# EasyEDA Pro project glyph_project_file.epro

# Schematic YourDisp
Board Name: YourDisp; Create Date: 2026-06-23; Page Name: Sheet_1; Project Name: yourdisp1; Schematic Name: YourDisp; Update Date: 2026-07-16; Add into BOM: yes; Company: Trust Me Bro; Convert to PCB: yes; Date: 2026-05-26; REV: 1.0; Sheet: 1/1; spicePre: .
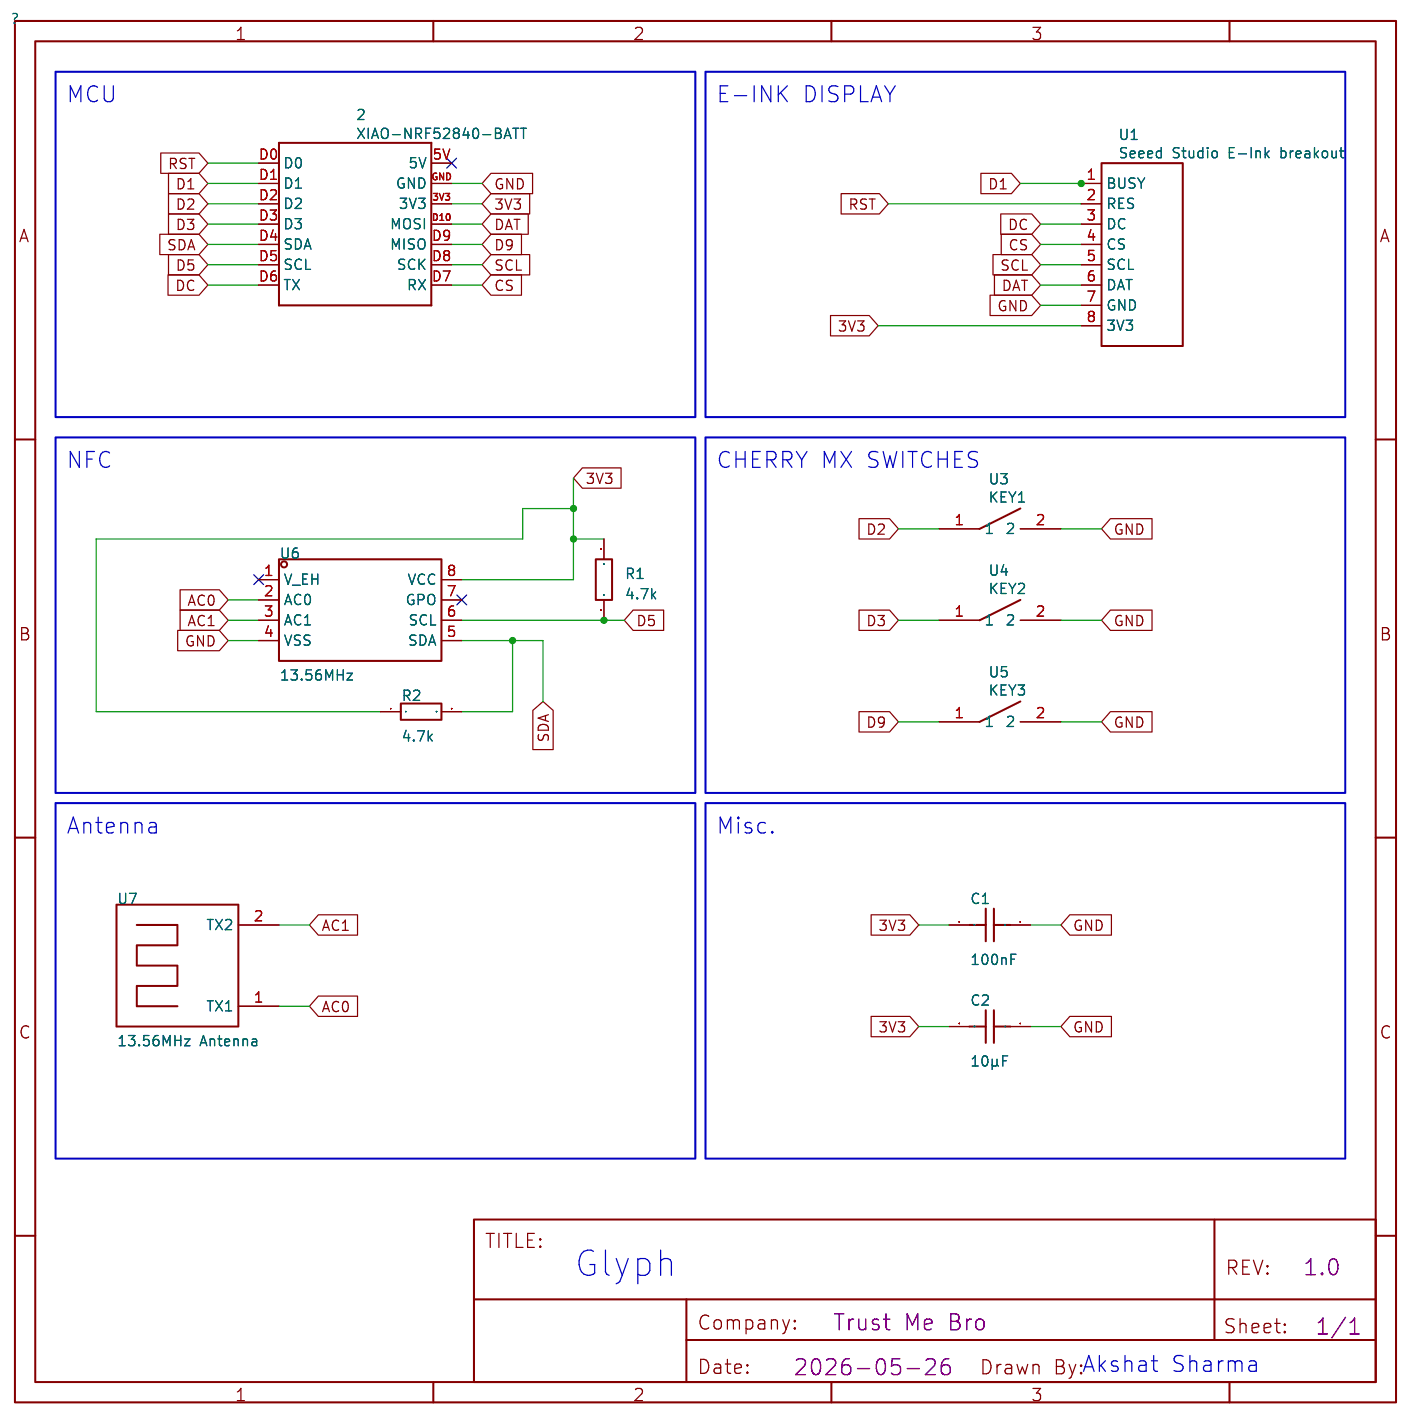
[diagram p0: schematic sheet]

## Parts
2  XIAO-NRF52840-BATT  [XIAO-NRF52840-BATT]
C1  100nF  [C0201]
C2  10µF  [C0201]
R1  4.7k  [R0402]
R2  4.7k  [R0402]
U1  Seeed Studio E-Ink breakout  [EPAPER BREAKOUT BOARD FOR SEEED STUDIO XIAO]
U3  KEY1  [CHERRY-MX_1U]
U4  KEY2  [CHERRY-MX_1U]
U5  KEY3  [CHERRY-MX_1U]
U6  13.56MHz  [SOIC-8_L5.0-W4.0-P1.27-LS6.0-BL]
U7  13.56MHz Antenna  [13.56MHZ-ANTENNA]

## Library data of the parts
2 = XIAO-NRF52840-BATT: Contributor: team6612; spicePre: ?
C1 C2 = CAP_0201: Supplier Footprint: 0201
R1 R2 = Res_0402: Supplier Footprint: 0402
U1 = Seeed Studio E-Ink breakout: Manufacturer: Seeed Studio; Manufacturer Part: 105990172; Supplier: Digi-Key; link: https://www.seeedstudio.com/ePaper-Breakout-Board-p-5804.html; Contributor: Guest; spicePre: U
U3 = KEY1: Contributor: tbremner_12; spicePre: U; spiceSymbolName: CHERRY-MX
U4 = KEY2: Contributor: tbremner_12; spicePre: U; spiceSymbolName: CHERRY-MX
U5 = KEY3: Contributor: tbremner_12; spicePre: U; spiceSymbolName: CHERRY-MX
U6 = ST25DV04K-IER6S3: agreement:ISO 15693,NFC Interface:I2C transmission rate:53Kbit/s Frequency:13.56MHz Frequency:13.56MHz Voltage - Supply:1.8V~5.5V Voltage - Supply:1.8V~5.5V Quiescent Current:1uA Features:Energy harvesting；Low power wake-up；Built-in non-volatile memory; LCSC Part Name: 动态NFC/RFID标签IC; Supplier Part: C155601; Manufacturer: ST(意法半导体); Supplier Footprint: SOIC-8; JLCPCB Part Class: Extended Part; Datasheet: https://item.szlcsc.com/datasheet/ST25DV04K-IER6S3/166943.html; Supplier: LCSC; agreement: ISO 15693,NFC; Interface: I2C; transmission rate: 53Kbit/s; Voltage - Supply: 1.8V~5.5V; Quiescent Current: 1uA; Features: Energy harvesting；Low power wake-up；Built-in non-volatile memory
U7 = 13.56MHz Antenna

## Nets
3V3: 2.3V3 C1.2 C2.2 R1.2 R2.1 U1.8(3V3) U6.8(VCC)
GND: 2.GND C1.1 C2.1 U1.7(GND) U3.2 U4.2 U5.2 U6.4(VSS)
AC0: U6.2(AC0) U7.1(TX1)
AC1: U6.3(AC1) U7.2(TX2)
CS: 2.D7(RX) U1.4(CS)
D1: 2.D1 U1.1(BUSY)
D2: 2.D2 U3.1
D3: 2.D3 U4.1
D5: 2.D5(SCL) R1.1 U6.6(SCL)
D9: 2.D9(MISO) U5.1
DAT: 2.D10(MOSI) U1.6(DAT)
DC: 2.D6(TX) U1.3(DC)
RST: 2.D0 U1.2(RES)
SCL: 2.D8(SCK) U1.5(SCL)
SDA: 2.D4(SDA) R2.2 U6.5(SDA)

Not connected (* = marked no-connect by the designer): 2 5V*; U6 1(V_EH)* 7(GPO)*

## Notes on the sheet
- MCU
- E-INK DISPLAY
- NFC
- CHERRY MX SWITCHES
- Antenna
- Misc.
- Glyph
- Akshat Sharma

# Board pcb_Yourdisp
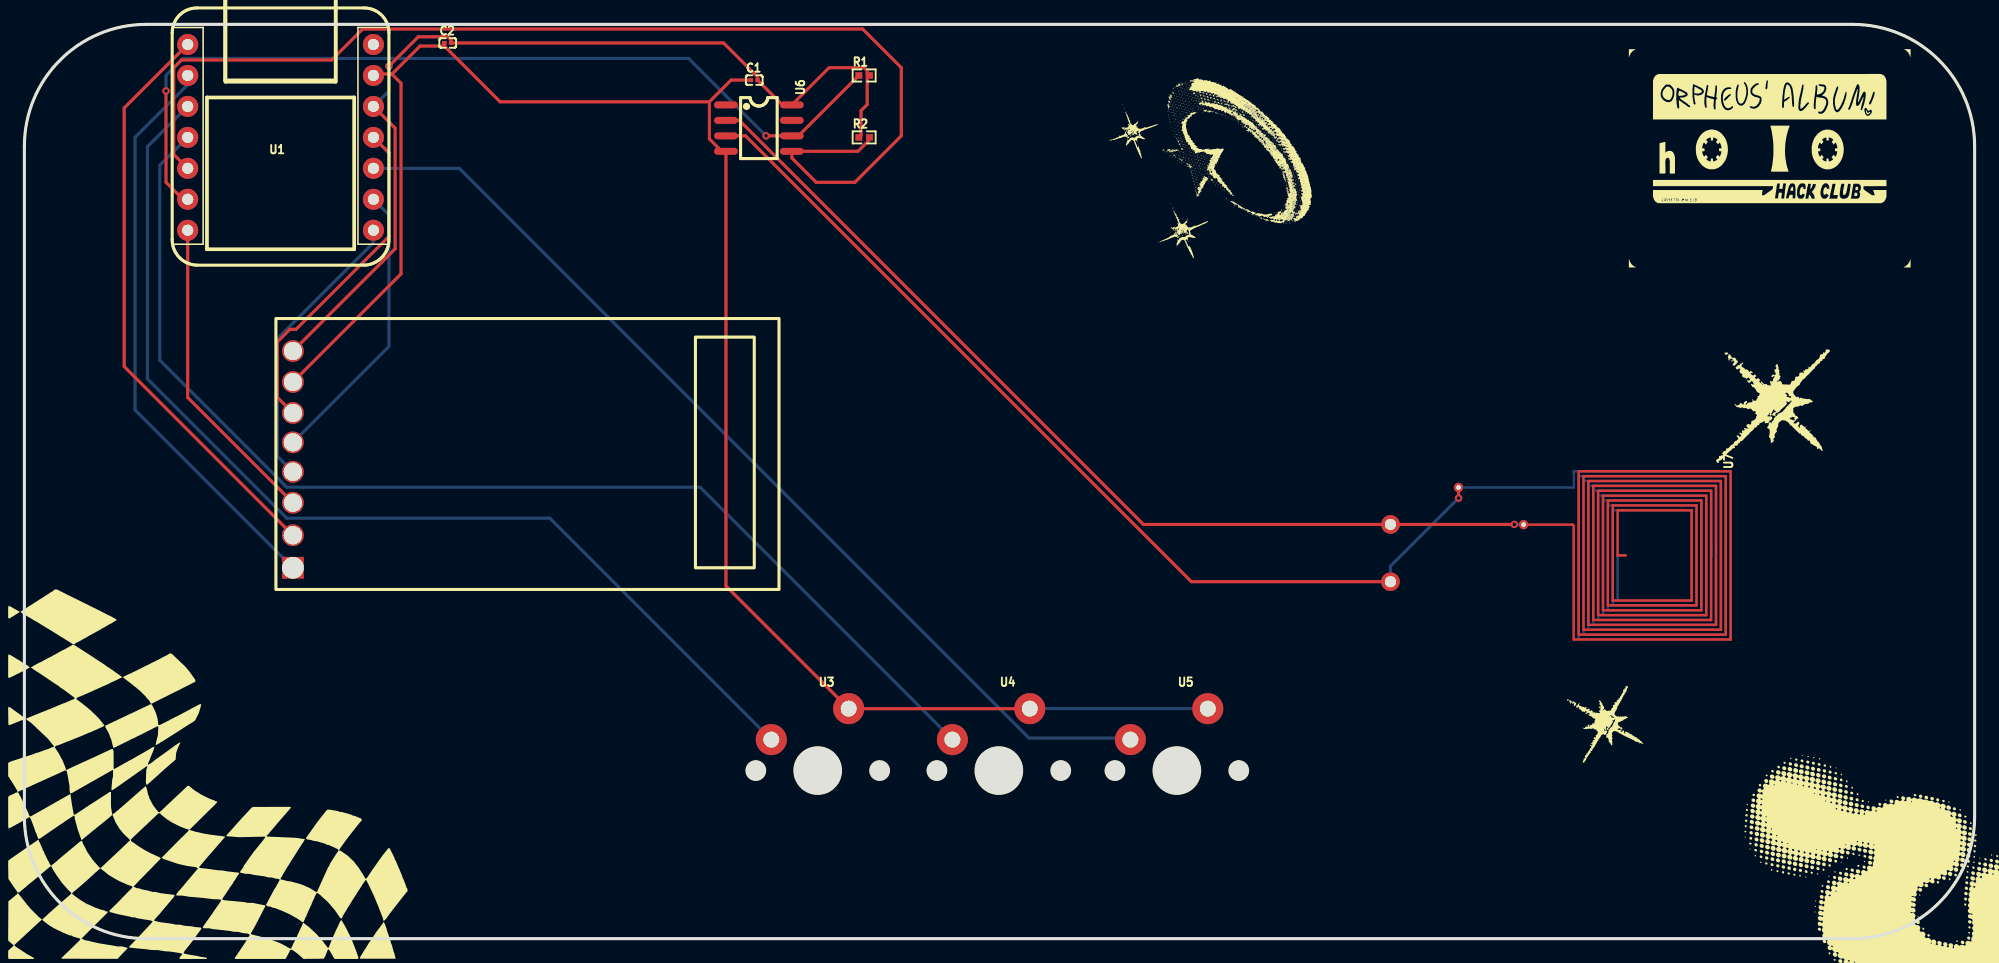
[diagram p1: board, top side]
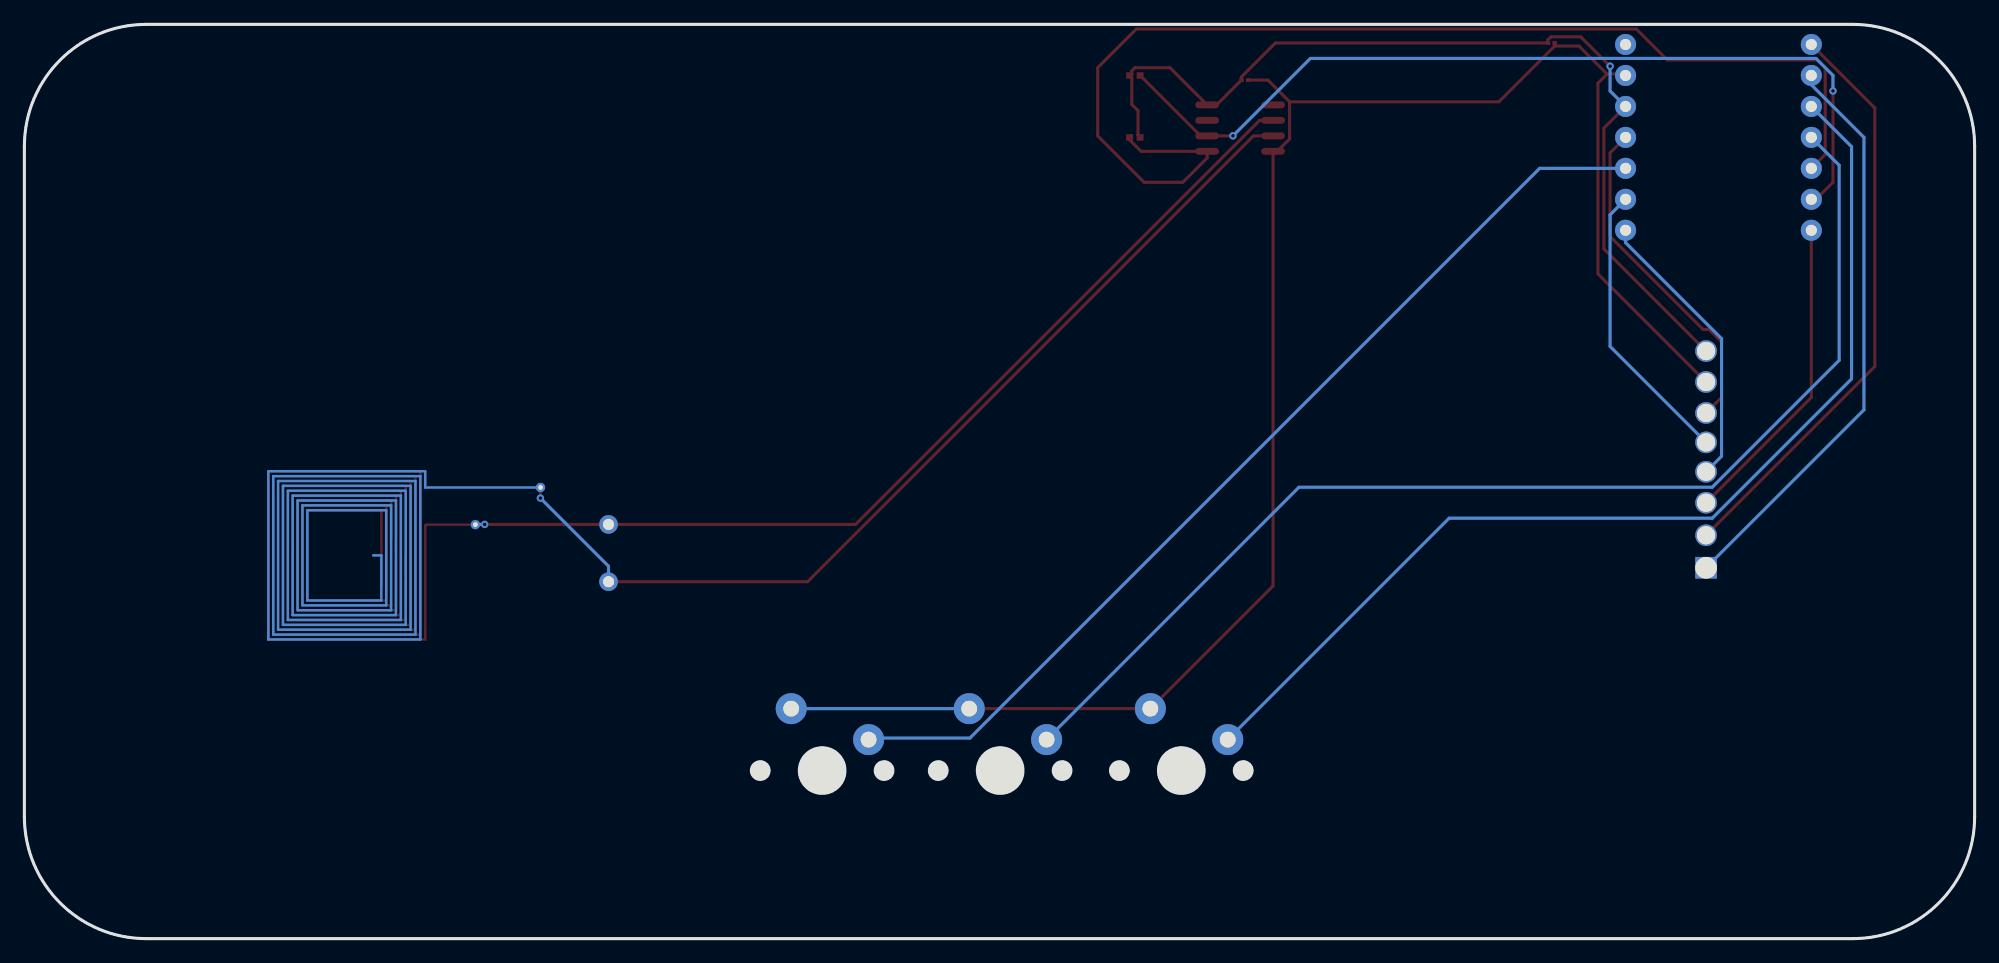
[diagram p2: board, bottom side, seen from below]

Outline 160 x 75 mm; copper layers: Top Layer, Bottom Layer. Coordinates in mm from the lower left corner of the outline.
Outline path: 0,65 arc(2.93,72.07) 10,75 150,75 arc(157.07,72.07) 160,65 160,10 arc(157.07,2.93) 150,0 10,0 arc(2.93,2.93) 0,10 0,65
Stack: Top Layer 0.035mm / Dielectric1 1.51mm FR4 er 4.5 / Bottom Layer 0.035mm

## Design rules (mm)
spacing Default (default): track to track 0.152, other pairs 0 to 0.152
spacing Plane_Default: track to track 0.152, other pairs 0 to 0.152
spacing Copper_Default: track to track 0.152, other pairs 0 to 0.152
track width Default (default): min 0.254, default 0.254, max 25.4
differential pair differentialPair (default): width min 0.127, default 0.254, max 2.54; gap min 0.152, default 0.152
net AC0 uses Copper_Default, Plane_Default
net AC1 uses Copper_Default, Plane_Default
net D2 uses Copper_Default, Plane_Default
net D3 uses Copper_Default, Plane_Default
net DC uses Copper_Default, Plane_Default
net SDA uses Copper_Default, Plane_Default
net CS uses Copper_Default, Plane_Default
net D9 uses Copper_Default, Plane_Default
net SCL uses Copper_Default, Plane_Default
net DAT uses Copper_Default, Plane_Default
net 3V3 uses Copper_Default, Plane_Default
net GND uses Copper_Default, Plane_Default
net D1 uses Copper_Default, Plane_Default

## Placement (name value [footprint] x y rotation side)
2  -  [XIAO-NRF52840-BATT]  21.02 65.73 0 top
C1  100nF  [C0201]  59.88 70.43 0 top
C2  10µF  [C0201]  34.73 73.48 0 top
NOREF  -  [Pad_e1]  112.08 33.98 0 top
NOREF#2  -  [Pad_e2]  112.08 29.28 0 top
R1  4.7k  [R0402]  68.9 70.81 0 top
R2  4.7k  [R0402]  68.9 65.73 0 top
U1  Seeed Studio E-Ink breakout  [EPAPER BREAKOUT BOARD FOR SEEED STUDIO XIAO]  20.64 50.87 0 top
U3  KEY1  [CHERRY-MX_1U]  65.09 13.79 0 top
U4  KEY2  [CHERRY-MX_1U]  79.94 13.79 0 top
U5  KEY3  [CHERRY-MX_1U]  94.55 13.79 0 top
U6  13.56MHz  [SOIC-8_L5.0-W4.0-P1.27-LS6.0-BL]  60.26 66.49 270 top
U7  13.56MHz Antenna  [13.56MHZ-ANTENNA]  131.38 31.44 270 top

## Footprints (pads in the part's own frame, mm; a bottom-side part is the same pattern mirrored in y, then rotated)
13.56MHZ-ANTENNA
  round 0.762 hole 0.381: 1(-2.52,-8.378) 2(-5.572,-13.725)
C0201
  rect 0.368x0.324 smd: 1(-0.275,0) 2(0.275,0)
CHERRY-MX_1U
  round 2.54 hole 1.3: 1(-3.81,2.54) 2(2.54,5.08)
EPAPER BREAKOUT BOARD FOR SEEED STUDIO XIAO
  rect 1.778x1.778 hole 59.1x1.016: 1(1.397,-20.447)
  round 1.778 hole 1.5x1.016: 2(1.397,-17.78) 3(1.397,-15.113) 4(1.397,-12.573) 5(1.397,-10.16) 6(1.397,-7.747) 7(1.397,-5.207) 8(1.397,-2.667)
Pad_e1
  round 1.524 hole 0.914: 1(0,0)
Pad_e2
  round 1.524 hole 0.914: 2(0,0)
R0402
  rect 0.566x0.54 smd: 1(-0.433,0) 2(0.433,0)
SOIC-8_L5.0-W4.0-P1.27-LS6.0-BL
  oval 0.569x1.95 smd: 1(-1.905,-2.705) 2(-0.635,-2.705) 3(0.635,-2.705) 4(1.905,-2.705) 5(1.905,2.705) 6(0.635,2.705) 7(-0.635,2.705) 8(-1.905,2.705)
XIAO-NRF52840-BATT
  round 1.728 hole 0.914: 3V3(7.62,2.54) 5V(7.62,7.62) D0(-7.62,7.62) D1(-7.62,5.08) D2(-7.62,2.54) D3(-7.62,0) D4(-7.62,-2.54) D5(-7.62,-5.08) D6(-7.62,-7.62) D7(7.62,-7.62) D8(7.62,-5.08) D9(7.62,-2.54) D10(7.62,0) GND(7.62,5.08)

## Nets
As in the schematic, except:
AC0: NOREF.1 U6.2 U7.1
AC1: NOREF#2.2 U6.3 U7.2

Pads without a net: 2 5V; U6 1 7

## Via types
v1: diameter 0.61, hole 0.305, Top Layer to Bottom Layer, 5 vias

## Routing (per net, layer and track width the routed paths; a pad name or vN(x,y) marks a point on that pad's centre or on a via; arc(x,y) is an arc through that point)
3V3: length 78.3
  Top Layer w0.254: 69.15,70.94 69.15,71.19 68.89,71.44 66.01,71.44 U6.8 62.19,68.4 C1.2 60.15,70.68 57.36,73.48 C2.2 35.01,73.73 34.75,73.98 32.32,73.98 v1(29.91,71.57) ; 69.15,70.94 69.15,68.43 68.64,67.92 68.64,65.91 R2.1 ; 69.15,70.94 R1.2 ; 28.64,68.27 30.42,66.49 30.42,56.59 U1.8
  Bottom Layer w0.254: 28.64,68.27 29.91,69.54 v1(29.91,71.57)
GND: length 148.3
  Top Layer w0.254: 2.GND 28.76,70.94 30.14,70.94 ; U4.2 U3.2 57.56,28.94 U6.4 57.22,64.59 56.2,65.6 56.2,68.65 ; 30.14,70.94 30.9,70.17 30.9,54.53 U1.7 ; 30.14,70.94 30.17,70.94 32.46,73.22 34.46,73.22 ; 34.46,73.22 39.03,68.65 56.2,68.65 ; 34.46,73.22 C2.1 ; 56.2,68.65 57.98,70.43 C1.1
  Bottom Layer w0.254: U4.2 U5.2
AC0: length 79.2
  Top Layer w0.254: U6.2 58.66,67.13 91.8,33.98 NOREF.1 v1(122.24,33.98)
  Bottom Layer w0.254: U7.1 122.98,33.98 v1(122.24,33.98)
AC1: length 79.7
  Top Layer w0.254: U7.2 117.66,37 v1(117.66,36.14) ; NOREF#2.2 95.74,29.28 59.16,65.86 U6.3
  Bottom Layer w0.254: NOREF#2.2 112.08,30.55 v1(117.66,36.14)
CS: length 23.6
  Bottom Layer w0.254: U1.4 20.76,39.57 20.76,49.22 28.64,57.09 2.D7
D1: length 47.5
  Bottom Layer w0.254: U1.1 9.08,43.38 9.08,65.73 13.4,70.05 2.D1
D2: length 87.2
  Bottom Layer w0.254: U3.1 43.12,34.49 21.53,34.49 10.09,45.92 10.09,64.97 13.4,68.27
D3: length 97.1
  Bottom Layer w0.254: 2.D3 11.11,63.44 11.11,47.44 21.53,37.03 55.43,37.03 U4.1
D5: length 73
  Top Layer w0.254: 13.02,60.65 11.62,62.05 11.62,69.67 ; R1.1 63.51,65.86 U6.6 v1(60.85,65.86)
  Bottom Layer w0.254: v1(11.62,69.54) 11.62,70.81 13.02,72.21 54.5,72.21 v1(60.85,65.86)
D9: length 81.5
  Bottom Layer w0.254: U5.1 90.61,16.45 82.42,16.45 35.69,63.19 2.D9
DAT: length 27.7
  Top Layer w0.254: 2.D10 29.91,64.46 29.91,57.6 22.29,49.98 21.78,49.98 20.76,48.97 20.76,44.39 U1.6
DC: length 25.9
  Top Layer w0.254: 2.D6 13.4,44.39 U1.3
RST: length 48.1
  Top Layer w0.254: 13.4,73.35 8.19,68.14 8.19,46.93 U1.2
SCL: length 23.7
  Bottom Layer w0.254: 2.D8 29.91,59.38 29.91,48.58 U1.5
SDA: length 95.5
  Top Layer w0.254: 2.D4 12.25,64.33 12.25,71.44 12.89,72.08 25.21,72.08 27.75,74.62 68.77,74.62 71.94,71.44 71.94,65.86 68.13,62.05 64.96,62.05 62.97,64.04 U6.5 68.38,64.59 69.33,65.53 R2.2
